# Altium schematic sheet MCU.SchDoc
size A4
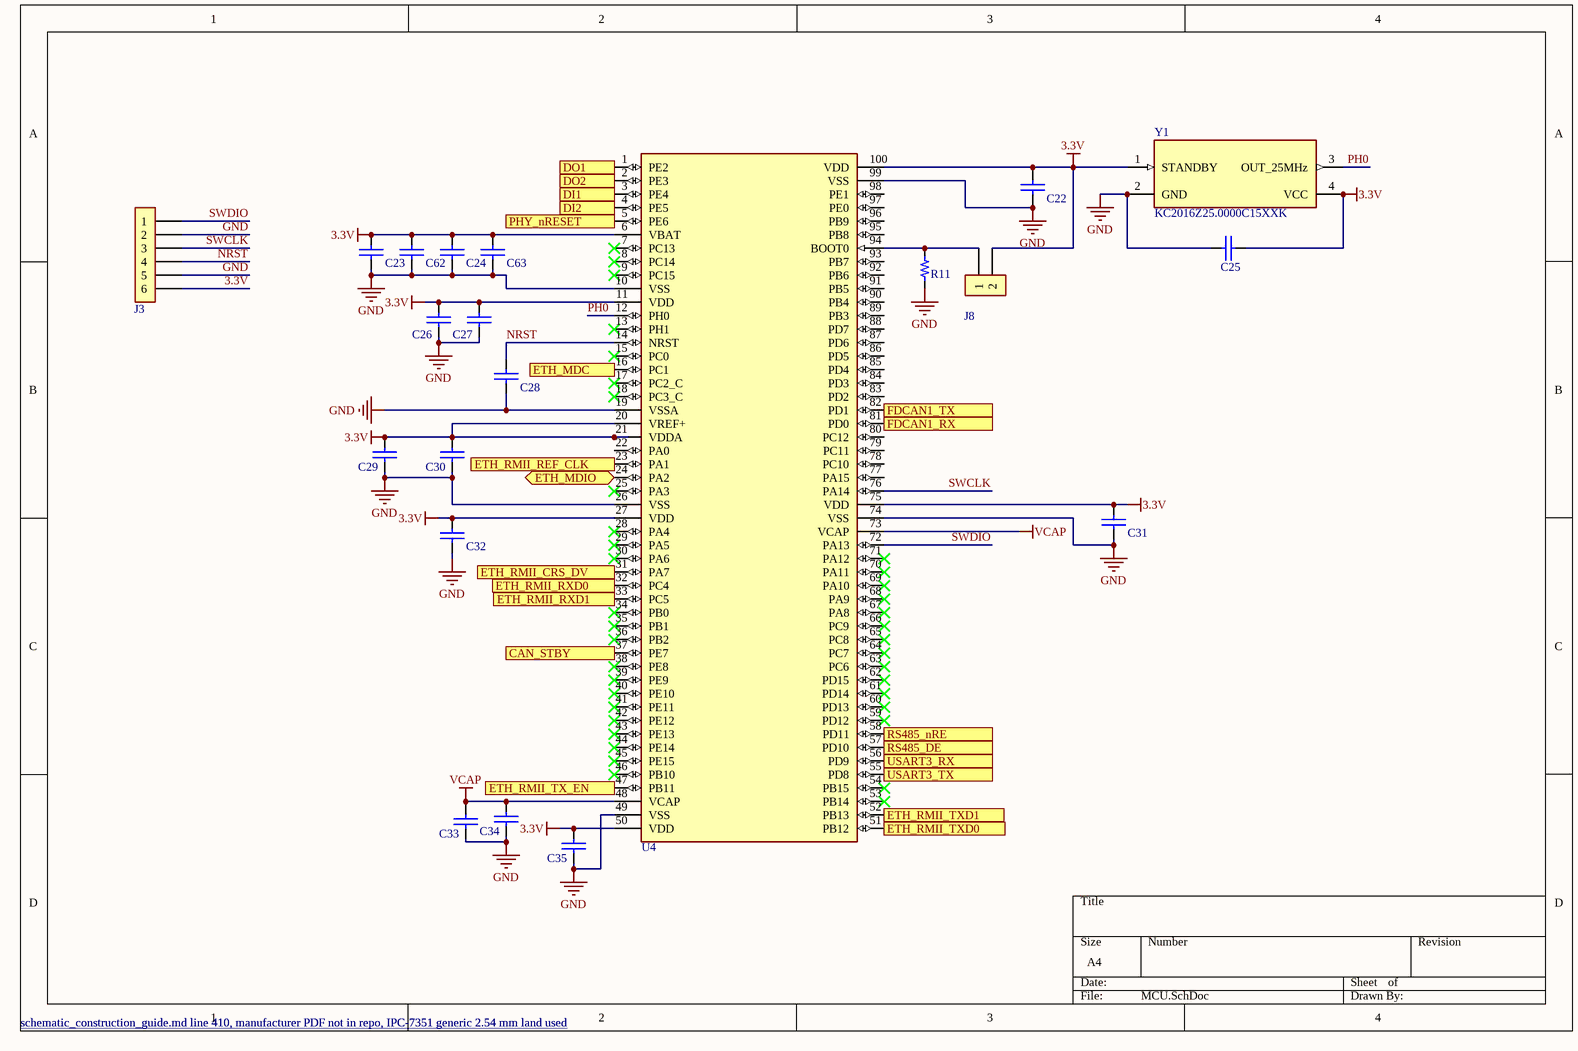
[diagram p0: MCU.SchDoc]

## Parts
C22  100 nF  [GW_0603_KEMET_NOMINAL]  (value not drawn)
C23  1 uF  [GW_SAMSUNG_CL10_1608_REFLOW]  (value not drawn)
C24  100 nF  [GW_0603_KEMET_NOMINAL]  (value not drawn)
C25  10 nF  [GW_0603_KEMET_NOMINAL]  (value not drawn)
C26  100 nF  [GW_0603_KEMET_NOMINAL]  (value not drawn)
C27  4.7 uF  [GW_0805_KEMET_NOMINAL]  (value not drawn)
C28  100 nF  [GW_0603_KEMET_NOMINAL]  (value not drawn)
C29  1 uF  [GW_SAMSUNG_CL10_1608_REFLOW]  (value not drawn)
C30  100 nF  [GW_0603_KEMET_NOMINAL]  (value not drawn)
C31  100 nF  [GW_0603_KEMET_NOMINAL]  (value not drawn)
C32  100 nF  [GW_0603_KEMET_NOMINAL]  (value not drawn)
C33  2.2 uF  [GW_0603_KEMET_NOMINAL]  (value not drawn)
C34  2.2 uF  [GW_0603_KEMET_NOMINAL]  (value not drawn)
C35  100 nF  [GW_0603_KEMET_NOMINAL]  (value not drawn)
C62  1 uF  [GW_SAMSUNG_CL10_1608_REFLOW]  (value not drawn)
C63  100 nF  [GW_0603_KEMET_NOMINAL]  (value not drawn)
J3  Source: schematic_construction_guide.md line 410, manufacturer PDF not in repo, IPC-7351 generic 2.54 mm land used  [GW_WRPHD_6X1_254_WURTH]  (hidden comment: 6 posiciones)
J8  Source: schematic_construction_guide.md line 410, manufacturer PDF not in repo, IPC-7351 generic 2.54 mm land used  [GW_WRPHD_2X1_254_WURTH]  (hidden comment: 2 posiciones)
R11  10 kOhm  [GW_RC0603_YAGEO_REFLOW]  (value not drawn)
U4  STM32H723VET6  [GW_LQFP100_ST_1L]  (value not drawn)
Y1  KC2016Z25.0000C15XXK  [GW_KC2016Z_KYOCERA]

## Ports
CAN_STBY (out), DI1 (in), DI2 (in), DO1 (in), DO2 (in), ETH_MDC (out), ETH_MDIO (bidir), ETH_RMII_CRS_DV (in), ETH_RMII_REF_CLK (in), ETH_RMII_RXD0 (in), ETH_RMII_RXD1 (in), ETH_RMII_TX_EN (out), ETH_RMII_TXD0 (out), ETH_RMII_TXD1 (out), FDCAN1_RX (in), FDCAN1_TX (out), PHY_nRESET (out), RS485_DE (out), RS485_nRE (out), USART3_RX (in), USART3_TX (out)

## Nets
3.3V: C22.1 C23.1 C24.1 C25.2 C26.1 C27.1 C29.1 C30.1 C31.1 C32.1 C35.1 C62.1 C63.1 J3.6 J8.2 U4.6(VBAT) U4.11(VDD) U4.20(VREF+) U4.21(VDDA) U4.27(VDD) U4.50(VDD) U4.75(VDD) U4.100(VDD) Y1.1(STANDBY) Y1.4(VCC)
GND: C22.2 C23.2 C24.2 C25.1 C26.2 C27.2 C28.2 C29.2 C30.2 C31.2 C32.2 C33.2 C34.2 C35.2 C62.2 C63.2 J3.2 J3.5 R11.2 U4.10(VSS) U4.19(VSSA) U4.26(VSS) U4.49(VSS) U4.74(VSS) U4.99(VSS) Y1.2(GND)
VCAP: C33.1 C34.1 U4.48(VCAP) U4.73(VCAP)
CAN_STBY: U4.37(PE7) ; port CAN_STBY
DI1: U4.3(PE4) ; port DI1
DI2: U4.4(PE5) ; port DI2
DO1: U4.1(PE2) ; port DO1
DO2: U4.2(PE3) ; port DO2
ETH_MDC: U4.16(PC1) ; port ETH_MDC
ETH_MDIO: U4.24(PA2) ; port ETH_MDIO
ETH_RMII_CRS_DV: U4.31(PA7) ; port ETH_RMII_CRS_DV
ETH_RMII_REF_CLK: U4.23(PA1) ; port ETH_RMII_REF_CLK
ETH_RMII_RXD0: U4.32(PC4) ; port ETH_RMII_RXD0
ETH_RMII_RXD1: U4.33(PC5) ; port ETH_RMII_RXD1
ETH_RMII_TX_EN: U4.47(PB11) ; port ETH_RMII_TX_EN
ETH_RMII_TXD0: U4.51(PB12) ; port ETH_RMII_TXD0
ETH_RMII_TXD1: U4.52(PB13) ; port ETH_RMII_TXD1
FDCAN1_RX: U4.81(PD0) ; port FDCAN1_RX
FDCAN1_TX: U4.82(PD1) ; port FDCAN1_TX
NRST: C28.1 J3.4 U4.14(NRST)
PH0: U4.12(PH0) Y1.3(OUT_25MHz)
PHY_nRESET: U4.5(PE6) ; port PHY_nRESET
RS485_DE: U4.57(PD10) ; port RS485_DE
RS485_nRE: U4.58(PD11) ; port RS485_nRE
SWCLK: J3.3 U4.76(PA14)
SWDIO: J3.1 U4.72(PA13)
USART3_RX: U4.56(PD9) ; port USART3_RX
USART3_TX: U4.55(PD8) ; port USART3_TX
NetJ8_1: J8.1 R11.1 U4.94(BOOT0)

Not connected (* = marked no-connect by the designer): U4 7(PC13)* 8(PC14)* 9(PC15)* 13(PH1)* 15(PC0)* 17(PC2_C)* 18(PC3_C)* 22(PA0) 25(PA3)* 28(PA4)* 29(PA5)* 30(PA6)* 34(PB0)* 35(PB1)* 36(PB2)* 38(PE8)* 39(PE9)* 40(PE10)* 41(PE11)* 42(PE12)* 43(PE13)* 44(PE14)* 45(PE15)* 46(PB10)* 53(PB14)* 54(PB15)* 59(PD12)* 60(PD13)* 61(PD14)* 62(PD15)* 63(PC6)* 64(PC7)* 65(PC8)* 66(PC9)* 67(PA8)* 68(PA9)* 69(PA10)* 70(PA11)* 71(PA12)* 77(PA15) 78(PC10) 79(PC11) 80(PC12) 83(PD2) 84(PD3) 85(PD4) 86(PD5) 87(PD6) 88(PD7) 89(PB3) 90(PB4) 91(PB5) 92(PB6) 93(PB7) 95(PB8) 96(PB9) 97(PE0) 98(PE1)

## Library data of the parts
C22 C24 C26 C28 C30-C32 C35 C63 = GW_C0603C104K5RACTU_dc5e12a5: C0603C104K5RACTU; 100 nF; 50 V; X7R; -55..125 C; CAD_CANDIDATE; Manufacturer: KEMET; Tolerance: 10%; Electrical_Status: PROVISIONAL; CAD_Source: Professor_shared.SchLib glyph Cap_0.1uF_0603_50V; CAD_Limitations: Glyph pins/types inspected; exact manufacturer land-pattern/mask/paste qualification pending.; Electrical_Notes: Ficha KEMET local p1. Adaptar parametros; no usar el Y5V 0603F104Z500CT como equivalente. Modelo candidato existente; sin cotejo visual de pads/pines en Altium.; Manufacturer Part Number: C0603C104K5RACTU; Value: 100 nF; Rating: 50 V; X7R; -55..125 C; Power Rating: N/A; Package: 0603; CAD_Status: CAD_CANDIDATE
C23 C29 C62 = GW_CL10A105KB8NNNC_c3932faa: CL10A105KB8NNNC; 1 uF; 50 V; X5R; -55..85 C; CAD_CANDIDATE; Manufacturer: Samsung Electro-Mechanics; Tolerance: 10%; Electrical_Status: PROVISIONAL; CAD_Source: Professor_shared.SchLib glyph Cap_1uF_0603_50V; CAD_Limitations: Glyph pins/types inspected; exact manufacturer land-pattern/mask/paste qualification pending.; Electrical_Notes: Samsung ficha oficial; Ceff/ESR pendientes por aplicacion. Limite X5R 85 C: no homologado para ambiente superior. Modelo candidato existente; sin cotejo visual de pads/pines en Altium.; Manufacturer Part Number: CL10A105KB8NNNC; Value: 1 uF; Rating: 50 V; X5R; -55..85 C; Power Rating: N/A; Package: 0603; CAD_Status: CAD_CANDIDATE
C25 = GW_C0603C103K1RACTU_97f3ee33: C0603C103K1RACTU; 10 nF; 100 V; X7R; -55..125 C; CAD_CANDIDATE; Manufacturer: KEMET; Tolerance: 10%; Electrical_Status: PROVISIONAL; CAD_Source: Professor_shared.SchLib glyph Cap_0.1uF_0603_50V; CAD_Limitations: Glyph pins/types inspected; exact manufacturer land-pattern/mask/paste qualification pending.; Electrical_Notes: Ficha KEMET local DI_CIN p1; no confundir con externo CL10B103KA8WPNC 25 V. Modelo candidato existente; sin cotejo visual de pads/pines en Altium.; Manufacturer Part Number: C0603C103K1RACTU; Value: 10 nF; Rating: 100 V; X7R; -55..125 C; Power Rating: N/A; Package: 0603; CAD_Status: CAD_CANDIDATE
C27 = GW_C0805C475K4RACTU_82374e08: C0805C475K4RACTU; 4.7 uF; 16 V; X7R; CAD_CANDIDATE; Manufacturer: KEMET; Tolerance: 10%; Electrical_Status: PROVISIONAL; CAD_Source: Professor_shared.SchLib glyph Cap_10uF_0805_25V_; CAD_Limitations: Glyph pins/types inspected; exact manufacturer land-pattern/mask/paste qualification pending.; Electrical_Notes: Ceff a 3.3 V pendiente; no sustituir por 10 uF solo por disponibilidad. Modelo candidato existente; sin cotejo visual de pads/pines en Altium.; Manufacturer Part Number: C0805C475K4RACTU; Value: 4.7 uF; Rating: 16 V; X7R; Power Rating: N/A; Package: 0805; CAD_Status: CAD_CANDIDATE
C33 C34 = GW_C0603C225K8RACTU_46503424: C0603C225K8RACTU; 2.2 uF; 10 V; X7R; ESR <100 mOhm; CAD_CANDIDATE; Manufacturer: KEMET; Tolerance: 10% candidato; ST permite 20%; Electrical_Status: PROVISIONAL; CAD_Source: Professor_shared.SchLib glyph Cap_0.1uF_0603_50V; CAD_Limitations: Glyph pins/types inspected; exact manufacturer land-pattern/mask/paste qualification pending.; Electrical_Notes: Falta ESR y capacitancia bajo VCORE/temperatura/envejecimiento. No conectar 3.3 V ni carga externa a VCAP. Modelo candidato existente; sin cotejo visual de pads/pines en Altium.; Manufacturer Part Number: C0603C225K8RACTU; Value: 2.2 uF; Rating: 10 V; X7R; ESR <100 mOhm; Power Rating: N/A; Package: 0603; CAD_Status: CAD_CANDIDATE
J3 = GW_H_Male_6x1_TH_100mil_c0450d1e: TBD; 6 posiciones; TBD; CAD_CANDIDATE; Manufacturer: Wurth Elektronik; Manufacturer Part Number: 61300611121; Electrical_Status: PROVISIONAL; CAD_Source: Professor_shared.SchLib glyph H_Male_6x1_TH_100mil; CAD_Limitations: Glyph pins/types inspected; exact manufacturer land-pattern/mask/paste qualification pending.; Electrical_Notes: Pinout, MPN y orientacion pendientes. No alimentar VDD desde VTref; SWD PA13/PA14 y NRST. Modelo candidato existente; sin cotejo visual de pads/pines en Altium.; Value: 6 posiciones; Tolerance: TBD; Rating: TBD; Power Rating: N/A; Package: TBD; CAD_Status: CAD_CANDIDATE
J8 = GW_H_Male_2x1_TH_100mil_f89d9046: TBD; 2 posiciones; TBD; CAD_CANDIDATE; Manufacturer: Wurth Elektronik; Manufacturer Part Number: 61300211121; Electrical_Status: PROVISIONAL; CAD_Source: Professor_shared.SchLib glyph H_Male_2x1_TH_100mil; CAD_Limitations: Glyph pins/types inspected; exact manufacturer land-pattern/mask/paste qualification pending.; Electrical_Notes: Pinout, MPN y orientacion pendientes. No alimentar VDD desde VTref; SWD PA13/PA14 y NRST. Modelo candidato existente; sin cotejo visual de pads/pines en Altium.; Value: 2 posiciones; Tolerance: TBD; Rating: TBD; Power Rating: N/A; Package: TBD; CAD_Status: CAD_CANDIDATE
R11 = GW_FRC0603J103TS_7289f91d: FRC0603J103TS; 10 kOhm; >= 3.3 V; tension de trabajo por verificar; CAD_CANDIDATE; Manufacturer: FOJAN; Tolerance: 5%; Power Rating: 0.1 W; Electrical_Status: PROVISIONAL; CAD_Source: Professor_shared.SchLib glyph Res_10k_0603_1/10W; CAD_Limitations: Glyph pins/types inspected; exact manufacturer land-pattern/mask/paste qualification pending.; Electrical_Notes: Ratings transcritos del CAD; falta ficha FOJAN. Alternativa RC0603FR-0710KL con ficha oficial local, mismo footprint candidato. Modelo candidato existente; sin cotejo visual de pads/pines en Altium.; Manufacturer Part Number: FRC0603J103TS; Value: 10 kOhm; Rating: >= 3.3 V; tension de trabajo por verificar; Package: 0603; CAD_Status: CAD_CANDIDATE
U4 = STM32H723VET6: STM32H723VET6; CAD_CANDIDATE; GPIOs use bidirectional ERC type; oscillator pins have dedicated types. VCAP power pins are LDO outputs, never connect to VDD.; Manufacturer: STMicroelectronics; Electrical_Status: PROVISIONAL; CAD_Source: DS13313 Rev5 fig5, table7 pp57-71, fig65 p218 (PDF p219); Manufacturer Part Number: STM32H723VET6; Value: STM32H723VET6; CAD_Status: CAD_CANDIDATE; CAD_Limitations: GPIOs use bidirectional ERC type; oscillator pins have dedicated types. VCAP power pins are LDO outputs, never connect to VDD.
Y1 = KC2016Z25.0000C15XXK: Kyocera TNY1T-H1-DEX01-11 17-Jul-2026 pp4,6 table2 fig4; Two independent oscillators proposed; 10nF per supply. Tie1 to3V3. Load<=15pF and PHY phase-noise qualification pending.; CAD Status: CAD_CANDIDATE; Manufacturer: Kyocera; Manufacturer Part Number: KC2016Z25.0000C15XXK; Source: Kyocera TNY1T-H1-DEX01-11 17-Jul-2026 pp4,6 table2 fig4; Limitations: Two independent oscillators proposed; 10nF per supply. Tie1 to3V3. Load<=15pF and PHY phase-noise qualification pending.